# EasyEDA Pro project P3+KG.epro, schematic Schematic2_2
Board Name: Board2_2; Create Date: 2026-06-06; Page Name: P1; Project Name: P3; Schematic Name: Schematic2_2; Update Date: 2026-06-06; Company: 嘉立创EDA; Page Size: A4; Version: V1.0
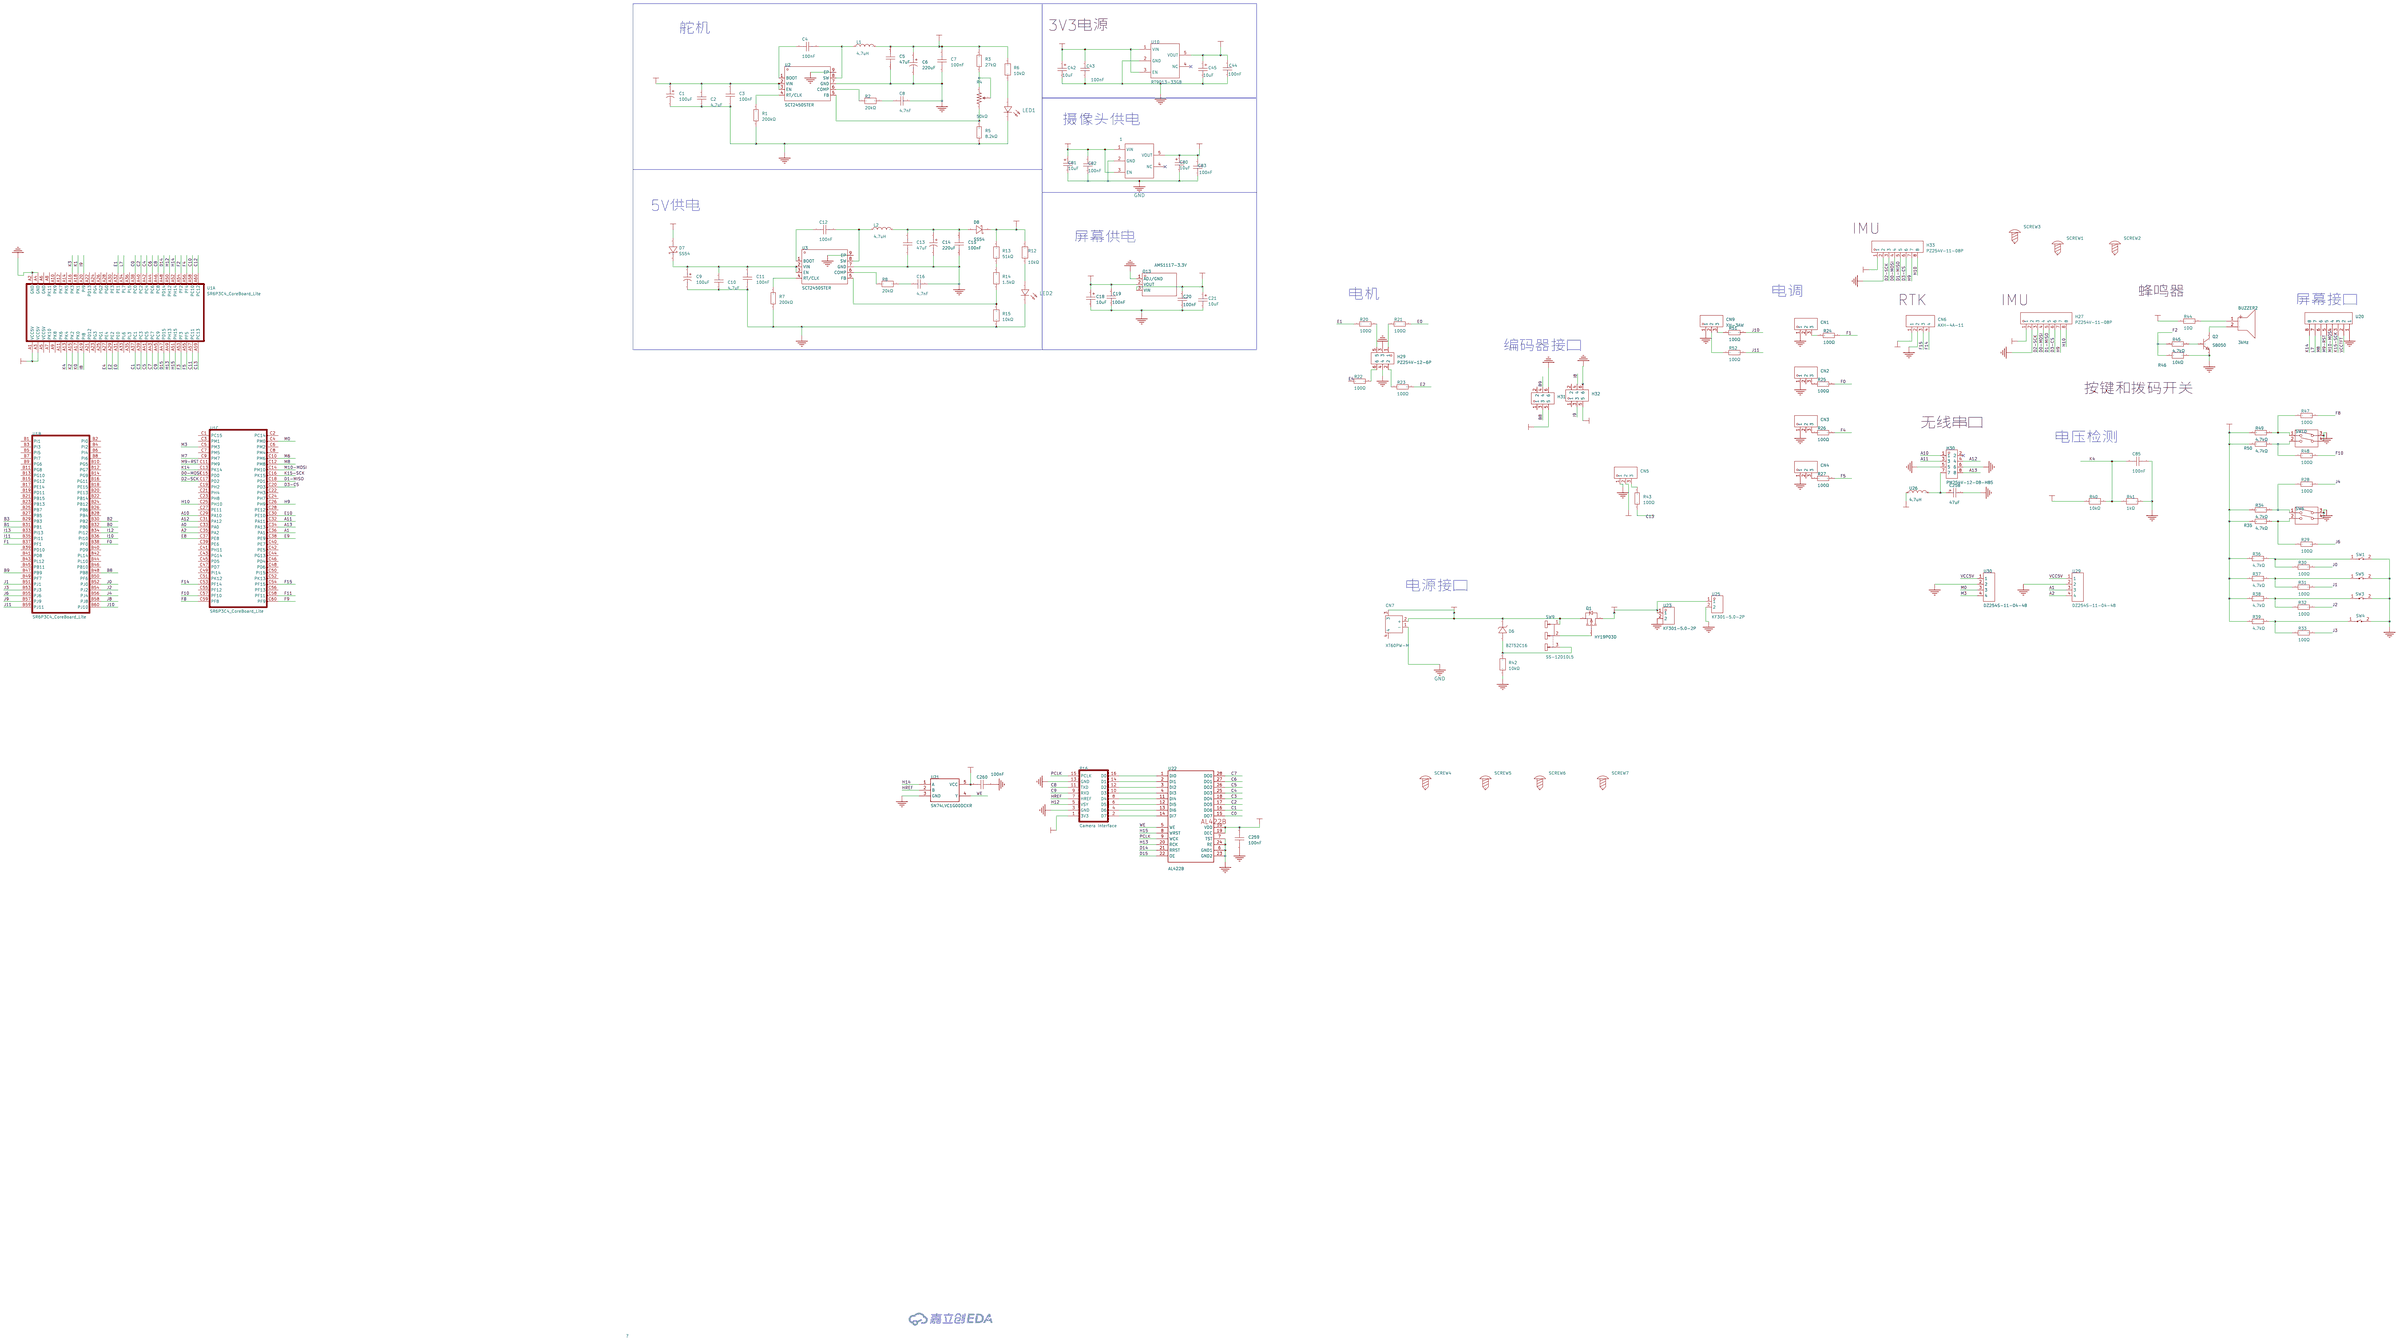
[diagram p3: schematic sheet]

## Parts
1  RT9013-33GB  [SOT-23-5_L3.0-W1.7-P0.95-LS2.8-BL]
BUZZER2  3kHz  [BUZ-TH_BD9.0-P5.00-D0.6-FD]
C1  100uF  [CAP-TH_BD6.3-P2.50-D0.6-FD]
C2  4.7uF  [C1206]
C3  100nF  [C0603]
C4  100nF  [C0603]
C5  47uF  [C1206]
C6  220uF  [CAP-TH_BD6.3-P2.50-D0.5-FD]
C7  100nF  [C0603]
C8  4.7nF  [C0805]
C9  100uF  [CAP-TH_BD6.3-P2.50-D0.6-FD]
C10  4.7uF  [C1206]
C11  100nF  [C0603]
C12  100nF  [C0603]
C13  47uF  [C1206]
C14  220uF  [CAP-TH_BD6.3-P2.50-D0.5-FD]
C15  100nF  [C0603]
C16  4.7nF  [C0805]
C18  10uF  [CAP-SMD_L3.2-W1.6-RD-C7171]
C19  100nF  [C0805]
C20  100nF  [C0805]
C21  10uF  [CAP-SMD_L3.2-W1.6-RD-C7171]
C42  10uF  [CAP-SMD_L3.2-W1.6-RD-C7171]
C43  100nF  [C0805]
C44  100nF  [C0805]
C45  10uF  [CAP-SMD_L3.2-W1.6-RD-C7171]
C80  10uF  [CAP-SMD_L3.2-W1.6-RD-C7171]
C81  10uF  [CAP-SMD_L3.2-W1.6-RD-C7171]
C82  100nF  [C0805]
C83  100nF  [C0805]
C85  100nF  [C0603]
C258  47uF  [CASE-B_3528]
C259  100nF  [C0603]
C260  100nF  [C0603]
CN1  ZX-XH2.54-3PZZ  [CONN-TH_3P-P2.54_2501S-3P]
CN2  ZX-XH2.54-3PZZ  [CONN-TH_3P-P2.54_2501S-3P]
CN3  ZX-XH2.54-3PZZ  [CONN-TH_3P-P2.54_2501S-3P]
CN4  ZX-XH2.54-3PZZ  [CONN-TH_3P-P2.54_2501S-3P]
CN5  ZX-XH2.54-3PZZ  [CONN-TH_3P-P2.54_2501S-3P]
CN6  AXH-4A-11  [CONN-TH_KH-XH-4A-Z]
CN7  XT60PW-M  [CONN-TH_XT60PW-M]
CN9  XH-3AW  [CONN-TH_3P-P2.54_HCTL_XH-3AW]
D6  BZT52C16  [SOD-123_L2.7-W1.6-LS3.7-RD]
D7  SS54  [SMA_L4.3-W2.6-LS5.0-FD]
D8  SS54  [SMA_L4.3-W2.6-LS5.0-FD]
H27  PZ254V-11-08P  [HDR-TH_8P-P2.54-V-M]
H29  PZ254V-12-6P  [HDR-TH_6P-P2.54-V-M-R2-C3-S2.54]
H30  PM254V-12-08-H85  [HDR-TH_8P-P2.54-V-F-R2-C4-S2.54]
H31  PZ254V-12-6P  [HDR-TH_6P-P2.54-V-M-R2-C3-S2.54]
H32  PZ254V-12-6P  [HDR-TH_6P-P2.54-V-M-R2-C3-S2.54]
H33  PZ254V-11-08P  [HDR-TH_8P-P2.54-V-M]
L1  4.7uH  [IND-SMD_L7.3-W6.6_YSPI07XX]
L2  4.7uH  [IND-SMD_L7.3-W6.6_YSPI07XX]
LED1  -  [LED_0603]
LED2  -  [LED_0603]
P16  Camera Interface  [Cam_HDR2X8]
Q1  HY19P03D  [TO-252-2_L6.6-W6.1-P4.57-LS9.9-TL-CW]
Q2  S8050  [SOT-23-3_L2.9-W1.3-P1.90-LS2.3-BR]
Q13  AMS1117-3.3V  [SOT-89-3_L4.5-W2.5-P1.50-LS4.2-BR]
R1  200kΩ  [R0603]
R2  20kΩ  [R0603]
R3  27kΩ  [R0603]
R4  50kΩ  [RES-ADJ-TH_3P-L9.5-W4.85-P2.50-BL-BS]
R5  8.2kΩ  [R0603]
R6  10kΩ  [R0603]
R7  200kΩ  [R0603]
R8  20kΩ  [R0603]
R12  10kΩ  [R0603]
R13  51kΩ  [R0603]
R14  1.5kΩ  [R0603]
R15  10kΩ  [R0603]
R20  100Ω  [R0603]
R21  100Ω  [R0603]
R22  100Ω  [R0603]
R23  100Ω  [R0603]
R24  100Ω  [R0603]
R25  100Ω  [R0603]
R26  100Ω  [R0603]
R27  100Ω  [R0603]
R28  100Ω  [R0603]
R29  100Ω  [R0603]
R30  100Ω  [R0603]
R31  100Ω  [R0603]
R32  100Ω  [R0603]
R33  100Ω  [R0603]
R34  4.7kΩ  [R0603]
R35  4.7kΩ  [R0603]
R36  4.7kΩ  [R0603]
R37  4.7kΩ  [R0603]
R38  4.7kΩ  [R0603]
R39  4.7kΩ  [R0603]
R40  10kΩ  [R0603]
R41  1kΩ  [R0603]
R42  10kΩ  [R0603]
R43  100Ω  [R0603]
R44  10Ω  [R0603]
R45  4.7kΩ  [R0603]
R46  10kΩ  [R0603]
R47  100Ω  [R0603]
R48  100Ω  [R0603]
R49  4.7kΩ  [R0603]
R50  4.7kΩ  [R0603]
R51  100Ω  [R0603]
R52  100Ω  [R0603]
SCREW1  -  [M3螺丝]
SCREW2  -  [M3螺丝]
SCREW3  -  [M3螺丝]
SCREW4  -  [M3螺丝]
SCREW5  -  [M3螺丝]
SCREW6  -  [M3螺丝]
SCREW7  -  [M3螺丝]
SW1  K2-1107ST-A1SW-06  [SW-SMD_L6.0-W3.6-LS8.0]
SW3  K2-1107ST-A1SW-06  [SW-SMD_L6.0-W3.6-LS8.0]
SW4  K2-1107ST-A1SW-06  [SW-SMD_L6.0-W3.6-LS8.0]
SW5  K2-1107ST-A1SW-06  [SW-SMD_L6.0-W3.6-LS8.0]
SW6  DSWB02LHGET  [SW-TH_DSWB02LHGET]
SW9  SS-12D10L5  [SW-TH_SS-12D10L5]
SW10  DSWB02LHGET  [SW-TH_DSWB02LHGET]
U1  SR6P3C4_CoreBoard_Lite  [SR6P3C4_CoreBoard_Lite]  (sections 1,2,3)
U2  SCT2450STER  [ESOP-8_L4.9-W3.9-P1.27-LS6.0-BL-EP]
U3  SCT2450STER  [ESOP-8_L4.9-W3.9-P1.27-LS6.0-BL-EP]
U10  RT9013-33GB  [SOT-23-5_L3.0-W1.7-P0.95-LS2.8-BL]
U20  -  [HDR-TH_8P-P2.54-V-F-1]
U21  SN74LVC1G00DCKR  [SOT-353]
U22  AL422B  [SOP-28]
U23  KF301-5.0-2P  [CONN-TH_P5.00_KF301-5.0-2P]
U25  KF301-5.0-2P  [CONN-TH_P5.00_KF301-5.0-2P]
U26  4.7uH  [IND-SMD_L2.5-W2.0-VLS252012CX-150M]
U29  DZ254S-11-04-48  [HDR-SMD_4P-P2.54-V-M-LS4.8_R2]
U30  DZ254S-11-04-48  [HDR-SMD_4P-P2.54-V-M-LS4.8_R2]

## Library data of the parts
1 = RT9013-33GB: 输出类型:固定;输出极性:正;输出通道数:1;最大输入电压:5.5V;输出电压:3.3V;压差:400mV@(500mA);静态电流(地电流):-;输出电流:500mA;电源纹波抑制比(PSRR):50dB@(10kHz);噪声:-;特性:-;; LCSC Part Name: 正 Vin=5.5V Vout=3.3V 500mA 50dB@(10kHz); Supplier Part: C47773; Manufacturer: RICHTEK(立锜); Supplier Footprint: SOT-23-5; JLCPCB Part Class: Extended Part; Datasheet: https://atta.szlcsc.com/upload/public/pdf/source/20150504/1457707282459.pdf; Supplier: LCSC; Output Type: 固定; Output Polarity: 正; Maximum Input Voltage: 5.5V; Output Voltage: 3.3V; Dropout Voltage: 400mV@(500mA); Output Current: 500mA; Power Supply Rejection Ratio (PSRR): 50dB@(10kHz)
BUZZER2 = HNB09A03: 驱动方式:有源(内含驱动线路);构造类型:电磁式;频率:3kHz;声压(SPL):85dB@10cm;; LCSC Part Name: 电磁式有源一体蜂鸣器HNB09A03; Supplier Part: C96102; Manufacturer: 华能; Supplier Footprint: 插件,D=9mm; JLCPCB Part Class: 扩展库; Datasheet: https://atta.szlcsc.com/upload/public/pdf/source/20170522/1495448326172.pdf; Supplier: LCSC; Oscillator Circuit: 有源(内含驱动线路); Technology Type: 电磁式; Operating Voltage: 1.5V~4.5V; Current Consumption: 30mA; Sound Pressure Level (SPL): 85dB@10cm; Diameter (φD): 9mm; Height: 5.5mm; Operating Temperature: -20℃~+70℃
C1 C9 = ERA35V100M6X7: 容值:100uF;精度:±20%;额定电压:35V;纹波电流:101mA@120Hz;等效串联电阻(ESR):-;; LCSC Part Name: 100uF ±20% 35V; Supplier Part: C49256802; Manufacturer: JIERR(捷而瑞); Supplier Footprint: 插件,D6.3xL7mm; JLCPCB Part Class: 扩展库; Datasheet: https://item.szlcsc.com/datasheet/ERA35V100M6X7/51692202.html; Supplier: LCSC; Tolerance: ±20%; Voltage Rating: 35V; Ripple Current: 101mA@120Hz; Pin Spacing: 2.5mm; Diameter: 6mm; Height - Seated (Max): 7mm; Lifetime: 2000hrs@105℃; Operating Temperature: -40℃~+105℃
C2 C10 = GRM31CR71H475KA12L: 容值:4.7uF;精度:±10%;额定电压:50V;材质(温度系数):X7R;; LCSC Part Name: 4.7uF ±10% 50V; Supplier Part: C77096; Manufacturer: muRata(村田); Supplier Footprint: 1206; JLCPCB Part Class: 扩展库; Datasheet: https://atta.szlcsc.com/upload/public/pdf/source/20200305/C490387_23319AE8C154DEB24C505E6C82A8106A.pdf; Supplier: LCSC; Tolerance: ±10%; Voltage Rated: 50V; Temperature Coefficient: X7R
C3 C4 C7 C11 C12 C15 C259 C260 = CC0603KRX7R9BB104: 容值:100nF;精度:±10%;额定电压:50V;温度系数:X7R;; LCSC Part Name: 100nF ±10% 50V; Supplier Part: C14663; Manufacturer: YAGEO(国巨); Supplier Footprint: 0603; JLCPCB Part Class: 基础库; Datasheet: https://item.szlcsc.com/datasheet/CC0603KRX7R9BB104/15331.html; Supplier: LCSC; Tolerance: ±10%; Voltage Rating: 50V; Temperature Coefficient: X7R
C5 C13 = HGC1206R5476M250NSPJ: 容值:47uF;精度:±20%;额定电压:25V;温度系数:X5R;; LCSC Part Name: 47uF ±20% 25V; Supplier Part: C22367835; Manufacturer: Chinocera(华瓷); Supplier Footprint: 1206; JLCPCB Part Class: 扩展库; Datasheet: https://item.szlcsc.com/datasheet/HGC1206R5476M250NSPJ/23841140.html; Supplier: LCSC; Tolerance: ±20%; Voltage Rating: 25V; Temperature Coefficient: X5R
C6 C14 = ERG25V220M6X11: 容值:220uF;精度:±20%;额定电压:25V;纹波电流:510mA@100kHz;等效串联电阻(ESR):130mΩ@100kHz;; LCSC Part Name: 220uF ±20% 25V; Supplier Part: C47344177; Manufacturer: JIERR(捷而瑞); Supplier Footprint: 插件,D6.3xL11mm; JLCPCB Part Class: 扩展库; Datasheet: https://item.szlcsc.com/datasheet/ERG25V220M6X11/49556618.html; Supplier: LCSC; Tolerance: ±20%; Voltage Rating: 25V; Ripple Current: 510mA@100kHz; Equivalent Series Resistance(ESR): 130mΩ@100kHz; Pin Spacing: 2.5mm; Diameter: 6mm; Height - Seated (Max): 11mm; Lifetime: 2000hrs@105℃; Operating Temperature: -40℃~+105℃
C8 C16 = CL21B472KBANNNC: 容值:4.7nF;精度:±10%;额定电压:50V;温度系数:X7R;; LCSC Part Name: 4.7nF ±10% 50V; Supplier Part: C50131; Manufacturer: SAMSUNG(三星); Supplier Footprint: 0805; JLCPCB Part Class: 扩展库; Datasheet: https://item.szlcsc.com/datasheet/CL21B472KBANNNC/51140.html; Supplier: LCSC; Tolerance: ±10%; Voltage Rating: 50V; Temperature Coefficient: X7R
C18 C21 C42 C45 C80 C81 = TAJA106K016RNJ: 容值:10uF;精度:±10%;额定电压:16V;等效串联电阻:3Ω@100kHz;; LCSC Part Name: 10uF ±10% 16V; Supplier Part: C7171; Manufacturer: Kyocera AVX; Supplier Footprint: CASE-A-3216; JLCPCB Part Class: 基础库; Datasheet: https://atta.szlcsc.com/upload/public/pdf/source/20160107/1457707750344.pdf; Supplier: LCSC; Tolerance: ±10%; Rated Voltage: 16V; Equivalent Series Resistance(ESR): 3Ω@100kHz; Operating Temperature: -55℃~+125℃
C19 C20 C43 C44 = CC0805KRX7R9BB104: 容值:100nF;精度:±10%;额定电压:50V;材质(温度系数):X7R;; LCSC Part Name: 100nF ±10% 50V; Supplier Part: C49678; Manufacturer: YAGEO(国巨); Supplier Footprint: 0805; JLCPCB Part Class: 基础库; Datasheet: https://atta.szlcsc.com/upload/public/pdf/source/20180224/C181747_15194369449651363981.pdf; Supplier: LCSC; Tolerance: ±10%; Voltage Rated: 50V; Temperature Coefficient: X7R
C82 C83 = 0805B103K500NT_C52278: 容值:10nF;精度:±10%;额定电压:50V;材质(温度系数):X7R;; LCSC Part Name: 10nF ±10% 50V; Supplier Part: C52278; Manufacturer: FH(风华); Manufacturer Part: 0805B103K500NT; Supplier Footprint: 0805; JLCPCB Part Class: Extended Part; Datasheet: https://atta.szlcsc.com/upload/public/pdf/source/20200305/C486355_26A10D38EF8C2A5C37091D0039909270.pdf; Supplier: LCSC; Tolerance: ±10%; Voltage Rated: 50V; Temperature Coefficient: X7R
C85 = CAP_0603: Supplier Footprint: 0603
C258 = TAJB476K010RNJ: 容值:47uF;精度:±10%;额定电压:10V;等效串联电阻:1Ω@100kHz;; LCSC Part Name: 47uF ±10% 10V; Supplier Part: C22036; Manufacturer: Kyocera AVX; Supplier Footprint: CASE-B-3528; JLCPCB Part Class: 扩展库; Datasheet: https://atta.szlcsc.com/upload/public/pdf/source/20160107/1457707750344.pdf; Supplier: LCSC; Tolerance: ±10%; Rated Voltage: 10V; Equivalent Series Resistance(ESR): 1Ω@100kHz; Operating Temperature: -55℃~+125℃
CN1-CN5 = ZX-XH2.54-3PZZ: 插针结构:1x3P;间距:2.5mm;安装方式:直插;参考系列:XH;总PIN数:3P;排数:1;每排PIN数:3;行距:-;额定电流:3A;触头材质:黄铜;触头镀层:锡;工作温度:-25℃~+85℃;; LCSC Part Name: 1x3P 间距:2.5mm 直插 系列:XH; Supplier Part: C7429633; Manufacturer: Megastar(兆星); Supplier Footprint: 插件,P=2.5mm; JLCPCB Part Class: 扩展库; Datasheet: https://item.szlcsc.com/datasheet/ZX-XH2.54-3PZZ/8427550.html; Supplier: LCSC; Pins Structure: 1x3P; Pitch: 2.5mm; Mounting Type: 直插; Reference Series: XH; Number of Pins: 3P; Number of Rows: 1; Number of PINs Per Row: 3; Current Rating: 3A; Contact Material: 黄铜; Contact Plating: 锡; Operating Temperature: -25℃~+85℃; Voltage Rating: 250V; Plastic Material: PA66; Flame Retardant Rating: UL94V-0; Color: 白色; Z-Height of the Board: 7mm; X-Length of Bottom Edge on Board (Spacing Line): 10mm; Y-Width of Bottom Edge on Board: 5.9mm
CN6 = AXH-4A-11: 插针结构:1x4P;间距:2.5mm;安装方式:直插;参考系列:XH;总PIN数:4P;排数:1;每排PIN数:4;行距:2.5mm;额定电流:2A;触头材质:黄铜;触头镀层:锡;工作温度:-25℃~+85℃;; LCSC Part Name: 1x4P 间距:2.5mm 直插 系列:XH; Supplier Part: C42422439; Manufacturer: JXTCONN(聚兴泰); Supplier Footprint: 插件,P=2.54mm; JLCPCB Part Class: 扩展库; Datasheet: https://item.szlcsc.com/datasheet/AXH-4A-11/44442050.html; Supplier: LCSC; Pins Structure: 1x4P; Pitch: 2.5mm; Mounting Type: 直插; Reference Series: XH; Number of Pins: 4P; Number of Rows: 1; Number of PINs Per Row: 4; Row Spacing: 2.5mm; Current Rating: 2A; Contact Material: 黄铜; Contact Plating: 锡; Operating Temperature: -25℃~+85℃; Voltage Rating: 250V; Plastic Material: PA66; Flame Retardant Rating: UL94V-0; Color: 白色; Z-Height of the Board: 7mm; X-Length of Bottom Edge on Board (Spacing Line): 12.5mm; Y-Width of Bottom Edge on Board: 5.9mm
CN7 = XT60PW-M: 模型锂电连接器; LCSC Part Name: AMASS(艾迈斯)航模插头xt60连接器150公母对接pw锂电池公头 接PCB板卧式 黄色 公头XT60PW-M.G.Y; Supplier Part: C98732; Manufacturer: AMASS(艾迈斯); JLCPCB Part Class: 扩展库; Datasheet: https://item.szlcsc.com/datasheet/XT60PW-M/99942.html; Supplier: LCSC; colour: 黄色; Connector type: 卧式插头; interface form: 公头
CN9 = XH-3AW_C2908612: 插针结构:1x3P;间距:2.54mm;安装方式:弯插;参考系列:XH;总PIN数:3P;排数:1;每排PIN数:3;行距:-;额定电流:3A;触头材质:黄铜;触头镀层:锡;工作温度:-25℃~+85℃;; LCSC Part Name: 1x3P 间距:2.54mm 弯插 系列:XH; Supplier Part: C2908612; Manufacturer: HCTL(华灿天禄); Supplier Footprint: 弯插,P=2.5mm; JLCPCB Part Class: 扩展库; Datasheet: https://item.szlcsc.com/datasheet/XH-3AW/3184383.html; Supplier: LCSC; Pins Structure: 1x3P; Pitch: 2.54mm; Mounting Type: 弯插; Reference Series: XH; Number of Pins: 3P; Number of Rows: 1; Number of PINs Per Row: 3; Current Rating: 3A; Contact Material: 黄铜; Contact Plating: 锡; Operating Temperature: -25℃~+85℃; Voltage Rating: 250V; Plastic Material: PA66; Flame Retardant Rating: UL94V-0; Z-Height of the Board: 5.9mm; Y-Width of Bottom Edge on Board: 7mm
D6 = BZT52C16_C19077413: 二极管配置:独立式;稳压值(标称值):16V;稳压值(范围):15.2V~16.8V;功率(Pd):500mW;; Supplier Part: C19077413; Manufacturer: 宏迦橙; Supplier Footprint: SOD-123; JLCPCB Part Class: 扩展库; Datasheet: https://atta.szlcsc.com/upload/public/pdf/source/20231117/6E01C14CCA1A38C68A5225952E4BCE14.pdf; Supplier: LCSC; Diode Configuration: 独立式; Zener Voltage (Nom): 16V; Reverse Leakage Current (Ir): 100nA@11.2V; Zener Voltage (Range): 15.2V~16.8V; Power Dissipation: 500mW; Zener Impedance (Zzt): 45Ω
D7 D8 = SS54_C7420369: 二极管配置:独立式;正向压降(Vf):550mV@5.0A;直流反向耐压(Vr):40V;整流电流:5A;; LCSC Part Name: 电压:40V 电流:5A; Supplier Part: C7420369; Manufacturer: 宏迦橙; Supplier Footprint: SMA(DO-214AC); JLCPCB Part Class: 扩展库; Datasheet: https://atta.szlcsc.com/upload/public/pdf/source/20230828/254C3882F8647358AD9F60DD73611B5E.pdf; Supplier: LCSC; Diode Configuration: 独立式; Forward Voltage (Vf@If): 550mV@5.0A; Reverse Voltage (Vr): 40V; Rectified Current: 5A; Reverse Leakage Current (Ir): 50uA@40V
H27 H33 = PZ254V-11-08P: 插针结构:1x8P;间距:2.54mm;行距:-;圆针/方针:方针;安装方式:直插;排数:单排;总PIN位数:8P;额定电流:3A;额定电压:250V;配合针长度:6mm;塑高:2.5mm;端接针长度:3mm;触头材质:黄铜;触头镀层:-;工作温度:-40℃~+105℃;颜色:黑色;; LCSC Part Name: 1x8P 间距:2.54mm 方针 直插; Supplier Part: C492407; Manufacturer: XFCN(兴飞); Supplier Footprint: 插件,P=2.54mm; JLCPCB Part Class: 扩展库; Datasheet: https://item.szlcsc.com/datasheet/PZ254V-11-08P/502963.html; Supplier: LCSC; Pin Structure: 1x8P; Pitch: 2.54mm; Circluar Pins/Square Pins: 方针; Mounting Type: 直插; Number of Rows: 单排; Number of Pins: 8P; Current Rating: 3A; Voltage Rating (Max): 250V; Length of Mating Pin: 6mm; Insulation Height: 2.5mm; Length of End Connection Pin: 3mm; Contact Material: 黄铜; Operating Temperature: -40℃~+105℃; Color: 黑色
H29 H31 H32 = PZ254V-12-6P: 插针结构:2x3P;间距:2.54mm;行距:2.54mm;圆针/方针:方针;安装类型:直插;排数:双排;总PIN位数:6P;额定电流:-;额定电压:-;配合针长度:6mm;塑高:2.5mm;端接针长度:3mm;触头材质:黄铜;触头镀层:-;工作温度范围:-40℃~+105℃;颜色:黑色;; LCSC Part Name: 间距:2.54mm 2x3P 直插 方针; Supplier Part: C492420; Manufacturer: XFCN(兴飞); Supplier Footprint: 插件,P=2.54mm; JLCPCB Part Class: 扩展库; Datasheet: https://atta.szlcsc.com/upload/public/pdf/source/20200309/C492420_BAECB307B001054C09D200388220EAE6.pdf; Supplier: LCSC; Pin Structure: 2x3P; Pitch: 2.54mm; Row Spacing: 2.54mm; Circluar Pins/Square Pins: 方针; Mounting Type: 直插; Number of Rows: 双排; Number of Pins: 6P; Length of Mating Pin: 6mm; Insulation Height: 2.5mm; Length of End Connection Pin: 3mm; Contact Material: 黄铜; Operating Temperature Range: -40℃~+105℃; Color: 黑色
H30 = PM254V-12-08-H85: 插孔结构:2x4P;间距:2.54mm;行距:2.54mm;圆孔/方孔:方孔;安装方式:直插;排数:双排;总孔位数:8P;额定电流:3A;额定电压:250V;插孔方向:顶部;塑高:8.5mm;工作温度:-40℃~+105℃;; LCSC Part Name: 间距:2.54mm 2x4P 直插; Supplier Part: C2834799; Manufacturer: XFCN(兴飞); Supplier Footprint: 插件,P=2.54mm; JLCPCB Part Class: 扩展库; Datasheet: https://item.szlcsc.com/datasheet/PM254V-12-08-H85/2997439.html; Supplier: LCSC; Holes Structure: 2x4P; Pitch: 2.54mm; Row Spacing: 2.54mm; Circular Hole / Square Hole: 方孔; Mounting Type: 直插; Number of Rows: 双排; Number of Positions: 8P; Current Rating: 3A; Voltage Rating (Max): 250V; Holes Direction: 顶部; Insulation Height: 8.5mm; Operating Temperature: -40℃~+105℃
L1 L2 = SRG0624-4R7-M: 电感值:4.7uH;精度:±20%;额定电流:4.5A;饱和电流(Isat):8A;类型:一体成型电感;; LCSC Part Name: 高电流功率电感器，无卤素，采用金属粉末磁芯材料，磁屏蔽、低电磁干扰，高载流能力、低磁芯损耗，符合RoHS标准; Supplier Part: C53462981; Manufacturer: JIERR(捷而瑞); Supplier Footprint: SMD,7.3x6.6mm; JLCPCB Part Class: 扩展库; Datasheet: https://item.szlcsc.com/datasheet/SRG0624-4R7-M/56628176.html; Supplier: LCSC; Tolerance: ±20%; Current Rating: 4.5A; Current - Saturation(Isat): 8A; DC Resistance(DCR): 50mΩ; Type: 一体成型电感
LED1 LED2 = LED_0603-R: Supplier Footprint: 0603
P16 = Camera Interface: 摄像头转接板接口 2x8 双排座; componentDisplayMode: -1; LatestRevisionDate: 17-Jul-2002; LatestRevisionNote: Re-released for DXP Platform.; Publisher: Altium Limited; Price(RMB): 0.00; Footprint Name: Cam_HDR2X8-F-SMT
Q1 = HY19P03D: 类型:P沟道;漏源电压(Vdss):30V;连续漏极电流(Id):90A;功率(Pd):50W;导通电阻(RDS(on)@Vgs,Id):6mΩ@10V,45A;阈值电压(Vgs(th)@Id):3V@250uA;; LCSC Part Name: P沟道 耐压:30V 电流:90A; Supplier Part: C122492; Manufacturer: HUAYI(华羿微); Supplier Footprint: TO-252-2; JLCPCB Part Class: 扩展库; Datasheet: https://atta.szlcsc.com/upload/public/pdf/source/20170728/C122492_1501225751911848809.pdf; Supplier: LCSC; Type: P沟道; Drain Source Voltage (Vdss): 30V; Continuous Drain Current (Id): 90A; Power Dissipation (Pd): 50W; Drain Source On Resistance (RDS(on)@Vgs,Id): 6mΩ@10V,45A; Gate Threshold Voltage (Vgs(th)@Id): 3V@250uA
Q2 = S8050_C20069125: 晶体管类型:NPN;集电极电流(Ic):500mA;集射极击穿电压(Vceo):25V;功率(Pd):300mW;直流电流增益(hFE@Ic,Vce):120@50mA,1.0V;; LCSC Part Name: NPN 电流:500mA 耐压:25V; Supplier Part: C20069125; Manufacturer: 宏迦橙; Supplier Footprint: SOT-23; JLCPCB Part Class: 扩展库; Datasheet: https://atta.szlcsc.com/upload/public/pdf/source/20240403/2D78449C96B6E27F13BF8BDF79E27159.pdf; Supplier: LCSC; Transistor Type: NPN; Collector Current (Ic): 500mA; Collector-Emitter Breakdown Voltage (Vceo): 25V; Power Dissipation (Pd): 300mW; DC Current Gain (hFE@Ic,Vce): 120@50mA,1.0V; Transition Frequency (fT): 100MHz; Collector Cut-Off Current (Icbo): 100nA; Collector-Emitter Saturation Voltage (VCE(sat)@Ic,Ib): 600mV@500mA,50mA; Operating Temperature: -55℃~+150℃
Q13 = AMS1117-3.3V_C5120796: 输出类型:固定;最大输入电压:18V;输出电压:3.3V;最大输出电流:1A;输出极性:正极;; LCSC Part Name: 输入18V 输出3.3V 1A; Supplier Part: C5120796; Manufacturer: MSKSEMI(美森科); Supplier Footprint: SOT-89; JLCPCB Part Class: 扩展库; Datasheet: https://atta.szlcsc.com/upload/public/pdf/source/20231123/6117526697EB8BF6175FDEEBA0877266.pdf; Supplier: LCSC; Output Type: 固定; Maximum Input Voltage: 18V; Output Voltage: 3.3V; MAX Output Current: 1A; Dropout Voltage: 1.4V@(1A); standby current: 12mA; Operating Temperature: 0℃~+125℃; Output Polarity: 正极; Number of Outputs: 1
R1 R7 = 0603WAF2003T5E: 电阻类型:厚膜电阻;阻值:200kΩ;精度:±1%;功率:100mW;最大工作电压:75V;温度系数:±100ppm/℃;; LCSC Part Name: 200kΩ ±1% 100mW 厚膜电阻; Supplier Part: C25811; Manufacturer: UNI-ROYAL(厚声); Supplier Footprint: 0603; JLCPCB Part Class: 基础库; Datasheet: https://atta.szlcsc.com/upload/public/pdf/source/20200306/C422600_1E6D84923E4A46A82E41ADD87F860B5C.pdf; Supplier: LCSC; Type: 厚膜电阻; Tolerance: ±1%; Power(Watts): 100mW; Overload Voltage (Max): 75V; Temperature Coefficient: ±100ppm/℃; Operating Temperature Range: -55℃~+155℃
R2 R8 = FRC0603F2002TS: 电阻类型:厚膜电阻;阻值:20kΩ;精度:±1%;功率:100mW;工作电压:75V;温度系数:±100ppm/℃;; LCSC Part Name: 20kΩ ±1% 100mW 厚膜电阻; Supplier Part: C2907011; Manufacturer: FOJAN(富捷); Supplier Footprint: 0603; JLCPCB Part Class: 扩展库; Supplier: LCSC; Type: 厚膜电阻; Tolerance: ±1%; Power(Watts): 100mW; Voltage-Supply(Max): 75V; Temperature Coefficient: ±100ppm/℃; Operating Temperature: -55℃~+155℃
R3 = 0603WAF2702T5E: 电阻类型:厚膜电阻;阻值:27kΩ;精度:±1%;功率:100mW;工作电压:75V;温度系数:±100ppm/℃;; LCSC Part Name: 27kΩ ±1% 100mW 厚膜电阻; Supplier Part: C22967; Manufacturer: UNI-ROYAL(厚声); Supplier Footprint: 0603; JLCPCB Part Class: 基础库; Datasheet: https://item.szlcsc.com/datasheet/0603WAF2702T5E/23694.html; Supplier: LCSC; Type: 厚膜电阻; Tolerance: ±1%; Power(Watts): 100mW; Voltage-Supply(Max): 75V; Temperature Coefficient: ±100ppm/℃; Operating Temperature: -55℃~+155℃
R4 = 3296W-1-503_C48997928: 阻值:50kΩ;精度:±10%;功率:500mW;温度系数:±250ppm/℃;; LCSC Part Name: 3296W-1-503; Supplier Part: C48997928; Manufacturer: JIERR(捷而瑞); Manufacturer Part: 3296W-1-503; Supplier Footprint: 插件-3P,9.5x4.9mm; JLCPCB Part Class: 扩展库; Datasheet: https://item.szlcsc.com/datasheet/3296W-1-503/51342064.html; Supplier: LCSC; Tolerance: ±10%; Power(Watts): 500mW; Temperature Coefficient: ±250ppm/℃; Number of Turns: 28
R5 = 0603WAF8201T5E: 电阻类型:厚膜电阻;阻值:8.2kΩ;精度:±1%;功率:100mW;工作电压:75V;温度系数:±100ppm/℃;; LCSC Part Name: 8.2kΩ ±1% 100mW 厚膜电阻; Supplier Part: C25981; Manufacturer: UNI-ROYAL(厚声); Supplier Footprint: 0603; JLCPCB Part Class: 基础库; Datasheet: https://item.szlcsc.com/datasheet/0603WAF8201T5E/26724.html; Supplier: LCSC; Type: 厚膜电阻; Tolerance: ±1%; Power(Watts): 100mW; Voltage-Supply(Max): 75V; Temperature Coefficient: ±100ppm/℃; Operating Temperature: -55℃~+155℃
R6 R12 R15 R40 R42 R46 = FRC0603J103TS: 电阻类型:厚膜电阻;阻值:10kΩ;精度:±5%;功率:100mW;最大工作电压:75V;温度系数:±100ppm/℃;; LCSC Part Name: 10kΩ ±5% 100mW 厚膜电阻; Supplier Part: C2930027; Manufacturer: FOJAN(富捷); Supplier Footprint: 0603; JLCPCB Part Class: 扩展库; Datasheet: https://atta.szlcsc.com/upload/public/pdf/source/20211221/925EC7D7225764EE0046F22065062C87.pdf; Supplier: LCSC; Type: 厚膜电阻; Tolerance: ±5%; Power(Watts): 100mW; Overload Voltage (Max): 75V; Temperature Coefficient: ±100ppm/℃; Operating Temperature Range: -55℃~+155℃
R13 = FRC0603F5102TS: 电阻类型:厚膜电阻;阻值:51kΩ;精度:±1%;功率:100mW;工作电压:75V;温度系数:±100ppm/℃;; LCSC Part Name: 51kΩ ±1% 100mW 厚膜电阻; Supplier Part: C2907049; Manufacturer: FOJAN(富捷); Supplier Footprint: 0603; JLCPCB Part Class: 扩展库; Supplier: LCSC; Type: 厚膜电阻; Tolerance: ±1%; Power(Watts): 100mW; Voltage-Supply(Max): 75V; Temperature Coefficient: ±100ppm/℃; Operating Temperature: -55℃~+155℃
R14 = FRC0603F1501TS: 电阻类型:厚膜电阻;阻值:1.5kΩ;精度:±1%;功率:100mW;工作电压:75V;温度系数:±100ppm/℃;; LCSC Part Name: 1.5kΩ ±1% 100mW 厚膜电阻; Supplier Part: C2930050; Manufacturer: FOJAN(富捷); Supplier Footprint: 0603; JLCPCB Part Class: 扩展库; Supplier: LCSC; Type: 厚膜电阻; Tolerance: ±1%; Power(Watts): 100mW; Voltage-Supply(Max): 75V; Temperature Coefficient: ±100ppm/℃; Operating Temperature: -55℃~+155℃
R20-R33 R43 R47 R48 R51 R52 = RC0603FR-07100RL: 电阻类型:厚膜电阻;阻值:100Ω;精度:±1%;功率:100mW;最大工作电压:75V;温度系数:±100ppm/℃;; LCSC Part Name: 厚膜电阻 100Ω ±1% 100mW; Supplier Part: C105588; Manufacturer: YAGEO(国巨); Supplier Footprint: 0603; JLCPCB Part Class: 扩展库; Datasheet: https://atta.szlcsc.com/upload/public/pdf/source/20180316/70C0E2BDAE7FCC62C531A5A58D202EE1.pdf; Supplier: LCSC; Type: 厚膜电阻; Tolerance: ±1%; Power(Watts): 100mW; Overload Voltage (Max): 75V; Temperature Coefficient: ±100ppm/℃; Operating Temperature Range: -55℃~+155℃
R34-R39 R45 R49 R50 = RC0603FR-074K7L: 电阻类型:厚膜电阻;阻值:4.7kΩ;精度:±1%;功率:100mW;工作电压:75V;温度系数:±100ppm/℃;; LCSC Part Name: 厚膜电阻 4.7kΩ ±1% 100mW; Supplier Part: C99782; Manufacturer: YAGEO(国巨); Supplier Footprint: 0603; JLCPCB Part Class: 扩展库; Datasheet: https://item.szlcsc.com/datasheet/RC0603FR-074K7L/100996.html; Supplier: LCSC; Type: 厚膜电阻; Tolerance: ±1%; Power(Watts): 100mW; Voltage-Supply(Max): 75V; Temperature Coefficient: ±100ppm/℃; Operating Temperature: -55℃~+155℃
R41 = FRC0603F1001TS: 电阻类型:厚膜电阻;阻值:1kΩ;精度:±1%;功率:100mW;工作电压:75V;温度系数:±100ppm/℃;; LCSC Part Name: 1kΩ ±1% 100mW 厚膜电阻; Supplier Part: C2907002; Manufacturer: FOJAN(富捷); Supplier Footprint: 0603; JLCPCB Part Class: 扩展库; Supplier: LCSC; Type: 厚膜电阻; Tolerance: ±1%; Power(Watts): 100mW; Voltage-Supply(Max): 75V; Temperature Coefficient: ±100ppm/℃; Operating Temperature: -55℃~+155℃
R44 = RC0603FR-0710RL: 电阻类型:厚膜电阻;阻值:10Ω;精度:±1%;功率:100mW;最大工作电压:75V;温度系数:±200ppm/℃;; LCSC Part Name: 厚膜电阻 10Ω ±1% 100mW; Supplier Part: C109318; Manufacturer: YAGEO(国巨); Supplier Footprint: 0603; JLCPCB Part Class: 扩展库; Datasheet: https://atta.szlcsc.com/upload/public/pdf/source/20180316/70C0E2BDAE7FCC62C531A5A58D202EE1.pdf; Supplier: LCSC; Type: 厚膜电阻; Tolerance: ±1%; Power(Watts): 100mW; Overload Voltage (Max): 75V; Temperature Coefficient: ±200ppm/℃; Operating Temperature Range: -55℃~+155℃
SCREW1-SCREW7 = M3螺丝: Supplier Footprint: 插件
SW1 SW3-SW5 = K2-1107ST-A1SW-06: 作用力:90gf;安装方式:立贴;开关长度:6.1mm;开关宽度:3.6mm;开关高度:2.5mm;触点电流:50mA;额定电压:12V;工作寿命:10万次;; LCSC Part Name: 3×6×2.5 进口弹片 有防水膜 灰胶头100G; Supplier Part: C707329; Manufacturer: 韩国韩荣; Supplier Footprint: SMD,6.1x3.6mm; JLCPCB Part Class: 扩展库; Datasheet: https://item.szlcsc.com/datasheet/K2-1107ST-A1SW-06/744451.html; Supplier: LCSC; Operating Force: 90gf; Mounting Type: 立贴; Length: 6.1mm; Width: 3.6mm; Switch Height: 2.5mm; Contact Current: 50mA; Voltage Rating: 12V; Life: 10万次; Operating Temperature: -25℃~+85℃
SW6 SW10 = DSWB02LHGET: 类型:平拨,凸起式;电路结构:单刀单掷;开关位数:2位;使用寿命:-;颜色:红色;; LCSC Part Name: 拨码开关,平拨开关,DSWB02LHGET; Supplier Part: C99421; Manufacturer: YE; Supplier Footprint: 插件; JLCPCB Part Class: 扩展库; Datasheet: https://atta.szlcsc.com/upload/public/pdf/source/20230906/EFD9230F686161BBBCD1B62855702D44.pdf; Supplier: LCSC; Type: 平拨,凸起式; Circuit: 单刀单掷; Number of Positions: 2位; Lead Pitch: 2.54mm; Color: 红色
SW9 = SS-12D10L5: 电路结构:单刀双掷;安装方式:直插;开关颜色:黑色;额定电流:3A;额定电压:125V;工作寿命:1万次;; LCSC Part Name: 柄长5mm 直插双档 滑动开关; Supplier Part: C319012; Manufacturer: XKB Connection(中国星坤); Supplier Footprint: 插件,13x6.8mm; JLCPCB Part Class: 扩展库; Datasheet: https://item.szlcsc.com/datasheet/SS-12D10L5/300104.html; Supplier: LCSC; Circuit: 单刀双掷; Actuator Style: 矩形柱状; Termination Style: PC引脚; Length: 13mm; Width: 6.8mm; Switch Height: 6.4mm; Mounting Type: 直插; Actuator Color: 黑色; Current Rating: 3A; Voltage Rating: 125V; Life: 1万次; Operating Temperature: -40℃~+85℃
U1 = SR6P3C4_CoreBoard_Lite: 逐飞科技 SR6P3C4_CoreBoard 核心板 BTB全引脚 无下载等引脚; componentDisplayMode: -1; Published: 8-Jun-2000; Revision: July-2002: Re-released for DXP Platform.; Publisher: Altium Limited; Imax: 50mA; DCR: .1m; Price(RMB): 0.000
U2 U3 = SCT2450STER: 功能类型:降压型;工作电压:3.8V~36V;输出电压:800mV~36V;输出电流:5A;输出类型:可调;; LCSC Part Name: 3.8V-36V输入，5A输出，高效率同步降压DC-DC转换器; Supplier Part: C509400; Manufacturer: SCT(芯洲科技); Supplier Footprint: ESOP-8; JLCPCB Part Class: 扩展库; Datasheet: https://item.szlcsc.com/datasheet/SCT2450STER/523158.html; Supplier: LCSC; Function: 降压型; Voltage - Supply: 3.8V~36V; Output Voltage: 800mV~36V; Output Current: 5A; Frequency - Switching: 100kHz~1.1MHz; Operating Temperature: -40℃~+125℃@(TJ); Synchronous Rectifier: 是; Number of Outputs: 1; Topology: 降压式; Quiescent Current: 25uA; Switch tube (built-in/external): 内置; Output Type: 可调
U10 = RT9013-33GB: 输出类型:固定;最大输入电压:5.5V;输出电压:3.3V;输出电流:500mA;电源纹波抑制比(PSRR):50dB@(10kHz);输出极性:正极;; LCSC Part Name: 输入5.5V 输出3.3V 500mA; Supplier Part: C47773; Manufacturer: RICHTEK(立锜); Supplier Footprint: SOT-23-5; JLCPCB Part Class: Extended Part; Datasheet: https://atta.szlcsc.com/upload/public/pdf/source/20150504/1457707282459.pdf; Supplier: LCSC; Output Type: 固定; Output Polarity: 正极; Number of Outputs: 1; Maximum Input Voltage: 5.5V; Output Voltage: 3.3V; Dropout Voltage: 400mV@(500mA); Output Current: 500mA; Feature: 低ESR；防静电保护；热保护(TSD)；过流保护(OCP)；带使能; Power Supply Rejection Ratio (PSRR): 50dB@(10kHz); standby current: 50uA; Operating Temperature: -40℃~+85℃
U20 = TFT1.8单
U21 = SN74LVC1G00DCKR: SN74LVC1G00DCKR 与非门; componentDisplayMode: -1
U22 = AL422B: 8路先入先出存储器(fifo); componentDisplayMode: -1; Revision: V1.0
U23 U25 = KF301-5.0-2P: 结构:1x2P;间距:5mm;颜色:蓝色;安装方式:直插;排数:1;每排PIN数:2;额定电流:17A;额定电压:250V;线规 - AWG:14~22;线规 - 平方毫米:1.5;工作温度:-30℃~+120℃;; LCSC Part Name: 1x2P 5mm 直插 排数:1 每排P数:2; Supplier Part: C474881; Manufacturer: KEFA(科发); Supplier Footprint: 插件,P=5mm; JLCPCB Part Class: 扩展库; Datasheet: https://item.szlcsc.com/datasheet/KF301-5.0-2P/481499.html; Supplier: LCSC; Number of Positions or Pins: 1x2P; Pitch: 5mm; Color: 蓝色; Mounting Type: 直插; Number of Pins: 2P; Number of Rows: 1; Number of PINs Per Row: 2; Current Rating: 17A; Voltage Rating (Max): 250V; Wire Gauge - AWG: 14~22; Wire Gauge - mm2: 1.5; Operating Temperature: -30℃~+120℃
U26 = FTC252010S4R7MBCA: 电感值:4.7uH;精度:±20%;额定电流:2A;饱和电流(Isat):2.6A;类型:一体成型电感;; LCSC Part Name: 4.7uH ±20% 2.6A; Supplier Part: C5832360; Manufacturer: cjiang(长江微电); Supplier Footprint: SMD,2x2.5mm; JLCPCB Part Class: 扩展库; Datasheet: https://atta.szlcsc.com/upload/public/pdf/source/20230602/8FFEDA9C0247A92A0D4B67554BFE4091.pdf; Supplier: LCSC; Tolerance: ±20%; Rated Current: 2A; Saturation Current (Isat): 2.6A; DC Resistance (DCR): 160mΩ; Type: 一体成型电感
U29 U30 = DZ254S-11-04-48: 插针结构:1x4P;间距:2.54mm;圆针/方针:方针;安装方式:立贴;排数:单排;总PIN位数:4P;额定电流:3A;配合针长度:6mm;塑高:2.54mm;触头材质:黄铜;触头镀层:金;颜色:黑色;; LCSC Part Name: 1x4P 间距:2.54mm 方针 立贴; Supplier Part: C5160787; Manufacturer: DEALON(德艺隆); Supplier Footprint: SMD,P=2.54mm(交错脚); JLCPCB Part Class: 扩展库; Datasheet: https://item.szlcsc.com/datasheet/DZ254S-11-04-48/5807883.html; Supplier: LCSC; Pin Structure: 1x4P; Pitch: 2.54mm; Circluar Pins/Square Pins: 方针; Mounting Type: 立贴; Number of Rows: 单排; Number of Pins: 4P; Current Rating: 3A; Length of Mating Pin: 6mm; Insulation Height: 2.54mm; Contact Material: 黄铜; Contact Plating: 金; Color: 黑色

## Nets
GND: 1.2(GND) C1.2 C2.1 C3.1 C5.1 C6.2 C7.1 C8.2 C9.2 C10.1 C11.1 C13.1 C14.2 C15.1 C16.2 C18.2 C19.1 C20.1 C21.2 C42.2 C43.1 C44.1 C45.2 C80.2 C81.2 C82.1 C83.1 C85.1 C258.2 C259.1 C260.1 CN1.1 CN2.1 CN3.1 CN4.1 CN5.1 CN6.2 CN7.1(-) CN9.1 H27.2 H29.3 H29.4 H30.5 H30.6 H31.6 H32.6 H33.2 LED1.1(C) LED2.1(C) P16.3(GND) P16.13(GND) Q2.2(E) Q13.1(ADJ/GND) R1.1 R5.1 R7.1 R15.1 R41.2 R42.1 R46.2 SW1.2 SW3.2 SW4.2 SW5.2 SW6.3 SW6.4 SW10.3 SW10.4 U1.A2(GND) U1.A4(GND) U2.7(GND) U2.9(EP) U3.7(GND) U3.9(EP) U10.2(GND) U20.1 U21.3(GND) U22.6(GND1) U22.7(TST) U22.23(GND2) U22.24(RE) U23.2 U25.2 U29.2 U30.2
VCC: CN7.2(+) CN7.3 D6.1(K) Q1.3(S) SW9.1
VCC3V3: C44.2 C45.1 H31.5 H32.5 H33.1 R34.1 R35.1 R36.1 R37.1 R38.1 R39.1 R49.1 R50.1 U10.5(VOUT)
VCC5V: 1.1(VIN) 1.3(EN) C20.2 C21.1 C42.1 C43.2 C81.1 C82.2 CN6.1 D8.2(K) Q13.3(VIN) R12.2 R13.2 U1.A1(VCC5V) U1.A3(VCC5V) U10.1(VIN) U10.3(EN) U26.1 U29.1 U30.1
VCCBAT: C1.1 C2.2 C3.2 D7.1(A) Q1.2(D) R40.1 U2.2(VIN) U2.3(EN) U23.1 U25.1
VCCCAM: 1.5(VOUT) C80.1 C83.2 C259.2 C260.2 P16.1(3V3) U21.5(VCC) U22.10(VDD) U22.19(DEC)
VCCSERVEO: CN5.2
VCCSERVO: C5.2 C6.1 C7.2 L1.2 R3.2 R6.2
VCCTFT: C18.1 C19.2 H27.1 Q13.2(VOUT) R44.1 U20.2
A0: U1.C33(PA0)
A1: U1.C36(PA1) U29.3
A2: U1.C35(PA2) U29.4
A10: H30.1 U1.C29(PA10)
A11: H30.3 U1.C32(PA11)
A12: H30.4 U1.C31(PA12)
A13: H30.8 U1.C34(PA13)
B0: U1.B32(PB0)
B1: U1.B31(PB1)
B2: U1.B30(PB2)
B3: U1.B29(PB3)
B8: H31.3 U1.B48(PB8)
B9: H31.4 U1.B47(PB9)
C0: U1.A38(PC0) U22.15(DO7)
C1: U1.A37(PC1) U22.16(DO6)
C2: U1.A40(PC2) U22.17(DO5)
C3: U1.A39(PC3) U22.18(DO4)
C4: U1.A42(PC4) U22.25(DO3)
C5: U1.A41(PC5) U22.26(DO2)
C6: U1.A44(PC6) U22.27(DO1)
C7: U1.A43(PC7) U22.28(DO0)
C8: P16.11(TXD) U1.A46(PC8)
C9: P16.9(RXD) U1.A45(PC9)
C10: U1.A58(PC10)
C11: U1.A57(PC11)
C12: U1.A60(PC12)
C13: R43.1 U1.A59(PC13)
D0-MOSI: H27.4 H33.4 U1.C15(PD0)
D1-MISO: H27.5 H33.5 U1.C18(PD1)
D2-SCK: H27.3 H33.3 U1.C17(PD2)
D3-CS: H27.6 H33.6 U1.C20(PD3)
D14: U1.A48(PD14) U22.21(RRST)
D15: U1.A47(PD15) U22.22(OE)
E0: R21.2 U1.A31(PE0)
E1: R20.1 U1.A32(PE1)
E2: R23.2 U1.A29(PE2)
E4: R22.1 U1.A27(PE4)
E8: U1.C37(PE8)
E9: U1.C38(PE9)
E10: U1.C30(PE10)
F0: R25.2 U1.B38(PF0)
F1: R24.2 U1.B37(PF1)
F2: R45.1 R46.1 U1.A54(PF2)
F3: U1.A53(PF3)
F4: R26.2 U1.A56(PF4)
F5: R27.2 U1.A55(PF5)
F8: R47.2 U1.C59(PF8)
F9: U1.C60(PF9)
F10: R48.2 U1.C57(PF10)
F11: U1.C58(PF11)
F14: CN6.4 U1.C53(PF14)
F15: CN6.3 U1.C54(PF15)
H9: H27.7 H33.7 U1.C26(PH9)
H10: H27.8 H33.8 U1.C25(PH10)
H12: P16.5(VSY) U1.A50(PH12)
H13: U1.A49(PH13) U22.20(RCK)
H14: U1.A52(PH14) U21.1(A)
H15: U1.A51(PH15) U22.8(WRST)
HREF: P16.7(HREF) U21.2(B)
I8: H32.4 U1.A19(PI8)
I9: H32.3 U1.A20(PI9)
I10: U1.B36(PI10)
I11: U1.B35(PI11)
I12: U1.B34(PI12)
I13: U1.B33(PI13)
J0: R30.2 U1.B52(PJ0)
J1: R31.2 U1.B51(PJ1)
J2: R32.2 U1.B54(PJ2)
J3: R33.2 U1.B53(PJ3)
J4: R28.2 U1.B56(PJ4)
J6: R29.2 U1.B55(PJ6)
J8: U1.B58(PJ8)
J9: U1.B57(PJ9)
J10: R51.2 U1.B60(PJ10)
J11: R52.2 U1.B59(PJ11)
K0: U1.A17(PK0)
K1: U1.A18(PK1)
K2: U1.A15(PK2)
K3: U1.A16(PK3)
K4: C85.2 R40.2 R41.1 U1.A13(PK4)
K14: U1.C13(PK14) U20.8
K15-SCK: U1.C16(PK15) U20.3
L7: U1.A34(PL7) U20.7
M0: U1.C4(PM0) U30.3
M3: U1.C5(PM3) U30.4
M6: U1.C10(PM6)
M7: U1.C9(PM7)
M8: U1.C12(PM8) U20.6
M9-RST: U1.C11(PM9) U20.5
M10-MOSI: U1.C14(PM10) U20.4
PCLK: P16.15(PCLK) U22.9(WCK)
WE: U21.4(Y) U22.5(WE)
$1N1463: R1.2 U2.4(RT/CLK)
$1N1588: C4.1 U2.1(BOOT)
$1N1593: C4.2 L1.1 U2.8(SW)
$1N1988: R2.1 U2.6(COMP)
$1N2063: C8.1 R2.2
$1N2398: R3.1 R4.2 R4.3
$1N2414: R4.1 R5.2 U2.5(FB)
$1N2591: LED1.2(A) R6.1
$1N3333: R7.2 U3.4(RT/CLK)
$1N3336: C12.1 U3.1(BOOT)
$1N3339: C12.2 L2.1 U3.8(SW)
$1N3365: R8.1 U3.6(COMP)
$1N3368: C16.1 R8.2
$1N3381: R13.1 R14.2
$1N3386: R14.1 R15.2 U3.5(FB)
$1N3390: LED2.2(A) R12.1
$1N7069: Q2.1(B) R45.2
$1N7071: BUZZER2.2(-) Q2.3(C)
$1N7072: BUZZER2.1(+) R44.2
$1N7096: R33.1 R39.2 SW4.1
$1N7099: R32.1 R38.2 SW3.1
$1N7102: R31.1 R37.2 SW5.1
$1N7105: R30.1 R36.2 SW1.1
$1N7129: R29.1 R35.2 SW6.2
$1N7130: R28.1 R34.2 SW6.1
$1N7136: C258.1 H30.7 U26.2
$1N7140: CN1.3 R24.1
$1N7193: H29.5 R20.2
$1N7194: H29.1 R21.1
$1N7631: H29.6 R22.2
$1N7670: H29.2 R23.1
$1N7746: CN2.3 R25.1
$1N7785: CN3.3 R26.1
$1N7824: CN4.3 R27.1
$1N8736: Q1.1(G) SW9.2
$1N8739: D6.2(A) R42.2 SW9.3
$1N8862: C9.1 C10.2 C11.2 D7.2(K) U3.2(VIN) U3.3(EN)
$1N8880: C13.2 C14.1 C15.2 D8.1(A) L2.2
$1N16652: CN5.3 R43.2
$1N17060: P16.16(D0) U22.1(DI0)
$1N17066: P16.14(D1) U22.2(DI1)
$1N17070: P16.12(D2) U22.3(DI2)
$1N17075: P16.10(D3) U22.4(DI3)
$1N17080: P16.8(D4) U22.11(DI4)
$1N17085: P16.6(D5) U22.12(DI5)
$1N17090: P16.4(D6) U22.13(DI6)
$1N17095: P16.2(D7) U22.14(DI7)
$1N17564: R48.1 R50.2 SW10.2
$1N17565: R47.1 R49.2 SW10.1
$1N37902: CN9.3 R51.1
$1N37946: CN9.2 R52.1

Not connected (* = marked no-connect by the designer): 1 4(NC)*; CN1 2; CN2 2; CN3 2; CN4 2; CN7 4; H30 2*; H31 1 2; H32 1 2; SCREW1 1; SCREW2 1; SCREW3 1; SCREW4 1; SCREW5 1; SCREW6 1; SCREW7 1; U1 A5(VCC5V) A6(GND) A7(PK10) A8(PK11) A9(PK8) A10(PK9) A11(PK6) A12(PK7) A14(PK5) A21(PD12) A22(PD13) A23(PG3) A24(PG4) A25(PG1) A26(PG2) A28(PG0) A30(PE3) A33(PL6) A35(PL3) A36(PL5) B1(PI1) B2(PI0) B3(PI3) B4(PI2) B5(PI5) B6(PI4) B7(PI7) B8(PI6) B9(PG6) B10(PG5) B11(PG8) B12(PG7) B13(PG10) B14(PG9) B15(PG12) B16(PG11) B17(PE14) B18(PE15) B19(PD11) B20(PE13) B21(PB15) B22(PB14) B23(PB13) B24(PB12) B25(PB7) B26(PB6) B27(PB5) B28(PB4) B39(PD10) B40(PD9) B41(PD8) B42(PL14) B43(PL12) B44(PL10) B45(PB11) B46(PB10) B49(PF7) B50(PF6) C1(PC15) C2(PC14) C3(PM1) C6(PM2) C7(PM5) C8(PM4) C19(PH2) C21(PH4) C22(PH3) C23(PH8) C24(PH7) C27(PE11) C28(PE12) C39(PE6) C40(PE7) C41(PH11) C42(PE5) C43(PG14) C44(PG13) C45(PD5) C46(PD4) C47(PD7) C48(PD6) C49(PI14) C50(PI15) C51(PK12) C52(PK13) C55(PF12) C56(PF13); U10 4(NC)*

## Notes on the sheet
- 3V3电源
- 舵机
- 摄像头供电
- 5V供电
- IMU
- 屏幕供电
- 电机
- 电调
- 蜂鸣器
- RTK
- IMU
- 屏幕接口
- 编码器接口
- 按键和拨码开关
- 无线串口
- 电压检测
- 电源接口
